# Altium schematic sheet Unified_Root.SchDoc
size A; DocumentNumber: 4; SheetNumber: 1; SheetTotal: 14
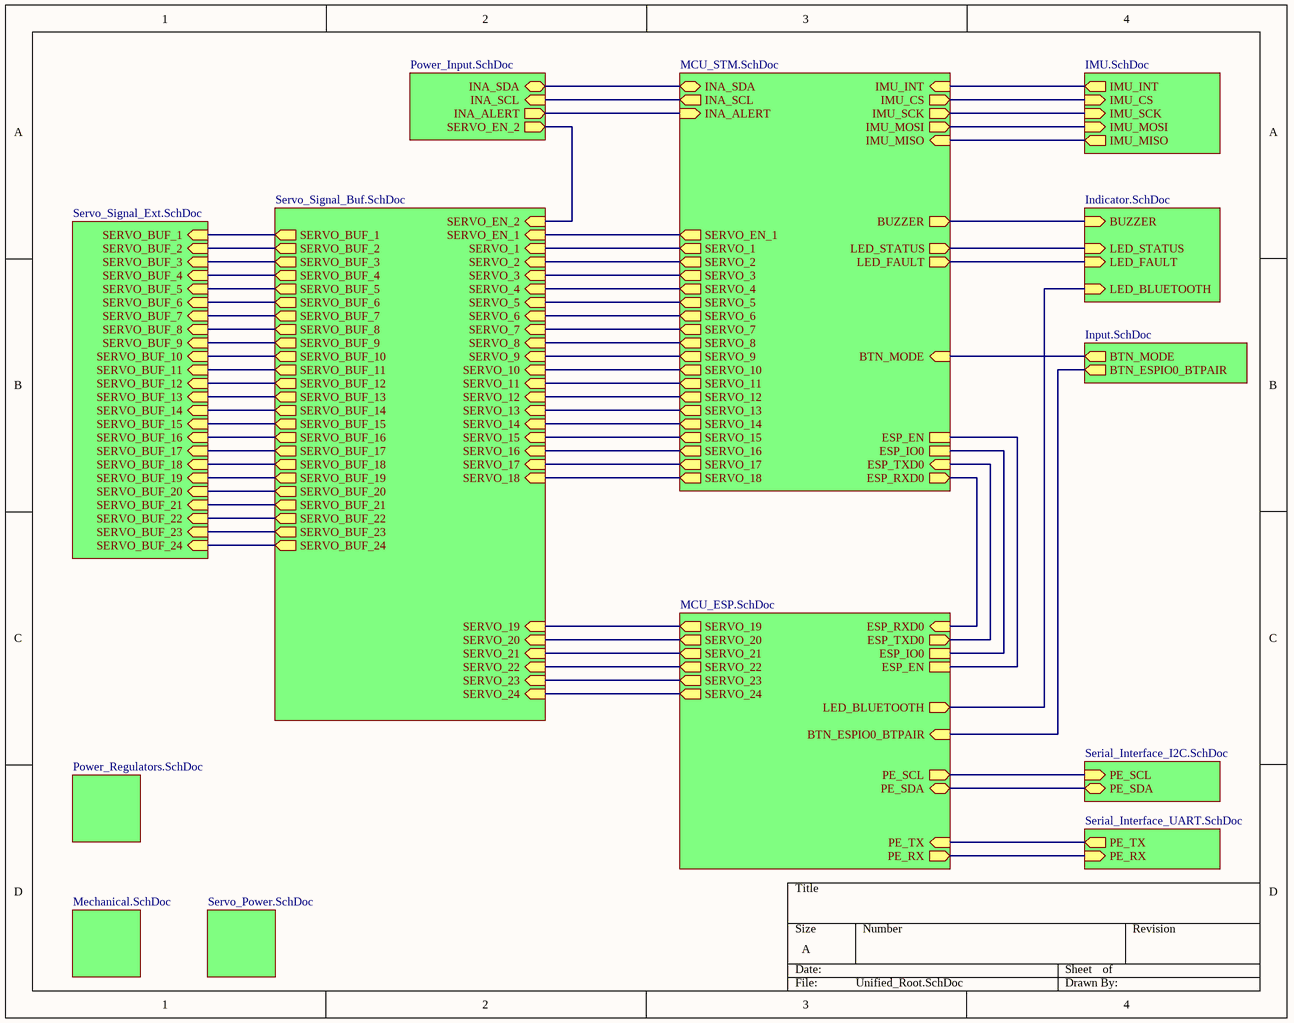
[diagram p0: Unified_Root.SchDoc]

## Sub-sheets
U_IMU = IMU.SchDoc: IMU_INT (out), IMU_CS (in), IMU_SCK (in), IMU_MOSI (in), IMU_MISO (out)
U_Indicator = Indicator.SchDoc: LED_STATUS (in), LED_FAULT (in), LED_BLUETOOTH (in), BUZZER (in)
U_Input = Input.SchDoc: BTN_ESPIO0_BTPAIR (out), BTN_MODE (out)
U_MCU_ESP = MCU_ESP.SchDoc: SERVO_19 (out), SERVO_20 (out), SERVO_21 (out), SERVO_22 (out), SERVO_23 (out), SERVO_24 (out), ESP_RXD0 (in), ESP_TXD0 (out), ESP_IO0, ESP_EN, PE_SCL (out), PE_SDA (bidir), PE_RX (out), PE_TX (in), BTN_ESPIO0_BTPAIR (in), LED_BLUETOOTH (out)
U_MCU_STM = MCU_STM.SchDoc: SERVO_1 (out), SERVO_2 (out), SERVO_3 (out), SERVO_4 (out), SERVO_5 (out), SERVO_6 (out), SERVO_7 (out), SERVO_8 (out), SERVO_9 (out), SERVO_10 (out), SERVO_11 (out), SERVO_12 (out), SERVO_13 (out), SERVO_14 (out), SERVO_15 (out), SERVO_16 (out), SERVO_17 (out), SERVO_18 (out), SERVO_EN_1 (out), INA_SDA (bidir), INA_SCL (out), INA_ALERT (in), IMU_INT (in), IMU_CS (out), IMU_SCK (out), IMU_MISO (in), IMU_MOSI (out), ESP_IO0, ESP_EN, ESP_RXD0 (out), ESP_TXD0 (in), BUZZER (out), LED_STATUS (out), LED_FAULT (out), BTN_MODE (in)
U_Mechanical = Mechanical.SchDoc: no entries
U_Power_Input = Power_Input.SchDoc: SERVO_EN_2 (out), INA_SCL (in), INA_ALERT (out), INA_SDA (bidir)
U_Power_Regulators = Power_Regulators.SchDoc: no entries
U_Serial_Interface_I2C = Serial_Interface_I2C.SchDoc: PE_SCL (in), PE_SDA (bidir)
U_Serial_Interface_UART = Serial_Interface_UART.SchDoc: PE_TX (out), PE_RX (in)
U_Servo_Power = Servo_Power.SchDoc: no entries
U_Servo_Signal_Buf = Servo_Signal_Buf.SchDoc: SERVO_1 (in), SERVO_2 (in), SERVO_3 (in), SERVO_4 (in), SERVO_5 (in), SERVO_6 (in), SERVO_7 (in), SERVO_8 (in), SERVO_9 (in), SERVO_10 (in), SERVO_11 (in), SERVO_12 (in), SERVO_13 (in), SERVO_14 (in), SERVO_15 (in), SERVO_16 (in), SERVO_17 (in), SERVO_18 (in), SERVO_EN_2 (in), SERVO_EN_1 (in), SERVO_BUF_1 (out), SERVO_BUF_2 (out), SERVO_BUF_3 (out), SERVO_BUF_4 (out), SERVO_BUF_5 (out), SERVO_BUF_6 (out), SERVO_BUF_7 (out), SERVO_BUF_8 (out), SERVO_BUF_9 (out), SERVO_BUF_10 (out), SERVO_BUF_11 (out), SERVO_BUF_12 (out), SERVO_BUF_13 (out), SERVO_BUF_14 (out), SERVO_BUF_15 (out), SERVO_BUF_16 (out), SERVO_BUF_17 (out), SERVO_BUF_18 (out), SERVO_BUF_19 (out), SERVO_BUF_20 (out), SERVO_BUF_21 (out), SERVO_BUF_22 (out), SERVO_BUF_23 (out), SERVO_BUF_24 (out), SERVO_24 (in), SERVO_23 (in), SERVO_22 (in), SERVO_21 (in), SERVO_20 (in), SERVO_19 (in)
U_Servo_Signal_Ext = Servo_Signal_Ext.SchDoc: SERVO_BUF_1 (in), SERVO_BUF_2 (in), SERVO_BUF_3 (in), SERVO_BUF_4 (in), SERVO_BUF_5 (in), SERVO_BUF_6 (in), SERVO_BUF_7 (in), SERVO_BUF_8 (in), SERVO_BUF_9 (in), SERVO_BUF_10 (in), SERVO_BUF_11 (in), SERVO_BUF_12 (in), SERVO_BUF_13 (in), SERVO_BUF_14 (in), SERVO_BUF_15 (in), SERVO_BUF_16 (in), SERVO_BUF_17 (in), SERVO_BUF_18 (in), SERVO_BUF_19 (in), SERVO_BUF_20 (in), SERVO_BUF_21 (in), SERVO_BUF_22 (in), SERVO_BUF_23 (in), SERVO_BUF_24 (in)

## Nets
(unnamed): sheet U_MCU_STM/SERVO_1, sheet U_Servo_Signal_Buf/SERVO_1
(unnamed): sheet U_MCU_STM/SERVO_2, sheet U_Servo_Signal_Buf/SERVO_2
(unnamed): sheet U_MCU_STM/SERVO_3, sheet U_Servo_Signal_Buf/SERVO_3
(unnamed): sheet U_MCU_STM/SERVO_4, sheet U_Servo_Signal_Buf/SERVO_4
(unnamed): sheet U_MCU_STM/SERVO_5, sheet U_Servo_Signal_Buf/SERVO_5
(unnamed): sheet U_MCU_STM/SERVO_6, sheet U_Servo_Signal_Buf/SERVO_6
(unnamed): sheet U_MCU_STM/SERVO_7, sheet U_Servo_Signal_Buf/SERVO_7
(unnamed): sheet U_MCU_STM/SERVO_8, sheet U_Servo_Signal_Buf/SERVO_8
(unnamed): sheet U_MCU_STM/SERVO_9, sheet U_Servo_Signal_Buf/SERVO_9
(unnamed): sheet U_MCU_STM/SERVO_10, sheet U_Servo_Signal_Buf/SERVO_10
(unnamed): sheet U_MCU_STM/SERVO_11, sheet U_Servo_Signal_Buf/SERVO_11
(unnamed): sheet U_MCU_STM/SERVO_12, sheet U_Servo_Signal_Buf/SERVO_12
(unnamed): sheet U_MCU_STM/SERVO_13, sheet U_Servo_Signal_Buf/SERVO_13
(unnamed): sheet U_MCU_STM/SERVO_14, sheet U_Servo_Signal_Buf/SERVO_14
(unnamed): sheet U_MCU_STM/SERVO_15, sheet U_Servo_Signal_Buf/SERVO_15
(unnamed): sheet U_MCU_STM/SERVO_16, sheet U_Servo_Signal_Buf/SERVO_16
(unnamed): sheet U_MCU_STM/SERVO_17, sheet U_Servo_Signal_Buf/SERVO_17
(unnamed): sheet U_MCU_STM/SERVO_18, sheet U_Servo_Signal_Buf/SERVO_18
(unnamed): sheet U_MCU_STM/SERVO_EN_1, sheet U_Servo_Signal_Buf/SERVO_EN_1
(unnamed): sheet U_MCU_STM/INA_SDA, sheet U_Power_Input/INA_SDA
(unnamed): sheet U_MCU_STM/INA_SCL, sheet U_Power_Input/INA_SCL
(unnamed): sheet U_MCU_STM/INA_ALERT, sheet U_Power_Input/INA_ALERT
(unnamed): sheet U_MCU_STM/IMU_INT, sheet U_IMU/IMU_INT
(unnamed): sheet U_MCU_STM/IMU_CS, sheet U_IMU/IMU_CS
(unnamed): sheet U_MCU_STM/IMU_SCK, sheet U_IMU/IMU_SCK
(unnamed): sheet U_MCU_STM/IMU_MISO, sheet U_IMU/IMU_MISO
(unnamed): sheet U_MCU_STM/IMU_MOSI, sheet U_IMU/IMU_MOSI
(unnamed): sheet U_MCU_STM/ESP_IO0, sheet U_MCU_ESP/ESP_IO0
(unnamed): sheet U_MCU_STM/ESP_EN, sheet U_MCU_ESP/ESP_EN
(unnamed): sheet U_MCU_STM/ESP_RXD0, sheet U_MCU_ESP/ESP_RXD0
(unnamed): sheet U_MCU_STM/ESP_TXD0, sheet U_MCU_ESP/ESP_TXD0
(unnamed): sheet U_MCU_STM/BUZZER, sheet U_Indicator/BUZZER
(unnamed): sheet U_MCU_STM/LED_STATUS, sheet U_Indicator/LED_STATUS
(unnamed): sheet U_MCU_STM/LED_FAULT, sheet U_Indicator/LED_FAULT
(unnamed): sheet U_MCU_STM/BTN_MODE, sheet U_Input/BTN_MODE
(unnamed): sheet U_Indicator/LED_BLUETOOTH, sheet U_MCU_ESP/LED_BLUETOOTH
(unnamed): sheet U_Serial_Interface_I2C/PE_SCL, sheet U_MCU_ESP/PE_SCL
(unnamed): sheet U_Serial_Interface_I2C/PE_SDA, sheet U_MCU_ESP/PE_SDA
(unnamed): sheet U_Servo_Signal_Buf/SERVO_EN_2, sheet U_Power_Input/SERVO_EN_2
(unnamed): sheet U_Servo_Signal_Buf/SERVO_BUF_1, sheet U_Servo_Signal_Ext/SERVO_BUF_1
(unnamed): sheet U_Servo_Signal_Buf/SERVO_BUF_2, sheet U_Servo_Signal_Ext/SERVO_BUF_2
(unnamed): sheet U_Servo_Signal_Buf/SERVO_BUF_3, sheet U_Servo_Signal_Ext/SERVO_BUF_3
(unnamed): sheet U_Servo_Signal_Buf/SERVO_BUF_4, sheet U_Servo_Signal_Ext/SERVO_BUF_4
(unnamed): sheet U_Servo_Signal_Buf/SERVO_BUF_5, sheet U_Servo_Signal_Ext/SERVO_BUF_5
(unnamed): sheet U_Servo_Signal_Buf/SERVO_BUF_6, sheet U_Servo_Signal_Ext/SERVO_BUF_6
(unnamed): sheet U_Servo_Signal_Buf/SERVO_BUF_7, sheet U_Servo_Signal_Ext/SERVO_BUF_7
(unnamed): sheet U_Servo_Signal_Buf/SERVO_BUF_8, sheet U_Servo_Signal_Ext/SERVO_BUF_8
(unnamed): sheet U_Servo_Signal_Buf/SERVO_BUF_9, sheet U_Servo_Signal_Ext/SERVO_BUF_9
(unnamed): sheet U_Servo_Signal_Buf/SERVO_BUF_10, sheet U_Servo_Signal_Ext/SERVO_BUF_10
(unnamed): sheet U_Servo_Signal_Buf/SERVO_BUF_11, sheet U_Servo_Signal_Ext/SERVO_BUF_11
(unnamed): sheet U_Servo_Signal_Buf/SERVO_BUF_12, sheet U_Servo_Signal_Ext/SERVO_BUF_12
(unnamed): sheet U_Servo_Signal_Buf/SERVO_BUF_13, sheet U_Servo_Signal_Ext/SERVO_BUF_13
(unnamed): sheet U_Servo_Signal_Buf/SERVO_BUF_14, sheet U_Servo_Signal_Ext/SERVO_BUF_14
(unnamed): sheet U_Servo_Signal_Buf/SERVO_BUF_15, sheet U_Servo_Signal_Ext/SERVO_BUF_15
(unnamed): sheet U_Servo_Signal_Buf/SERVO_BUF_16, sheet U_Servo_Signal_Ext/SERVO_BUF_16
(unnamed): sheet U_Servo_Signal_Buf/SERVO_BUF_17, sheet U_Servo_Signal_Ext/SERVO_BUF_17
(unnamed): sheet U_Servo_Signal_Buf/SERVO_BUF_18, sheet U_Servo_Signal_Ext/SERVO_BUF_18
(unnamed): sheet U_Servo_Signal_Buf/SERVO_BUF_19, sheet U_Servo_Signal_Ext/SERVO_BUF_19
(unnamed): sheet U_Servo_Signal_Buf/SERVO_BUF_20, sheet U_Servo_Signal_Ext/SERVO_BUF_20
(unnamed): sheet U_Servo_Signal_Buf/SERVO_BUF_21, sheet U_Servo_Signal_Ext/SERVO_BUF_21
(unnamed): sheet U_Servo_Signal_Buf/SERVO_BUF_22, sheet U_Servo_Signal_Ext/SERVO_BUF_22
(unnamed): sheet U_Servo_Signal_Buf/SERVO_BUF_23, sheet U_Servo_Signal_Ext/SERVO_BUF_23
(unnamed): sheet U_Servo_Signal_Buf/SERVO_BUF_24, sheet U_Servo_Signal_Ext/SERVO_BUF_24
(unnamed): sheet U_Servo_Signal_Buf/SERVO_24, sheet U_MCU_ESP/SERVO_24
(unnamed): sheet U_Servo_Signal_Buf/SERVO_23, sheet U_MCU_ESP/SERVO_23
(unnamed): sheet U_Servo_Signal_Buf/SERVO_22, sheet U_MCU_ESP/SERVO_22
(unnamed): sheet U_Servo_Signal_Buf/SERVO_21, sheet U_MCU_ESP/SERVO_21
(unnamed): sheet U_Servo_Signal_Buf/SERVO_20, sheet U_MCU_ESP/SERVO_20
(unnamed): sheet U_Servo_Signal_Buf/SERVO_19, sheet U_MCU_ESP/SERVO_19
(unnamed): sheet U_Input/BTN_ESPIO0_BTPAIR, sheet U_MCU_ESP/BTN_ESPIO0_BTPAIR
(unnamed): sheet U_MCU_ESP/PE_RX, sheet U_Serial_Interface_UART/PE_RX
(unnamed): sheet U_MCU_ESP/PE_TX, sheet U_Serial_Interface_UART/PE_TX